# Altium schematic sheet Breakout_schematic.SchDoc
size A3; SheetNumber: 1; SheetTotal: 1
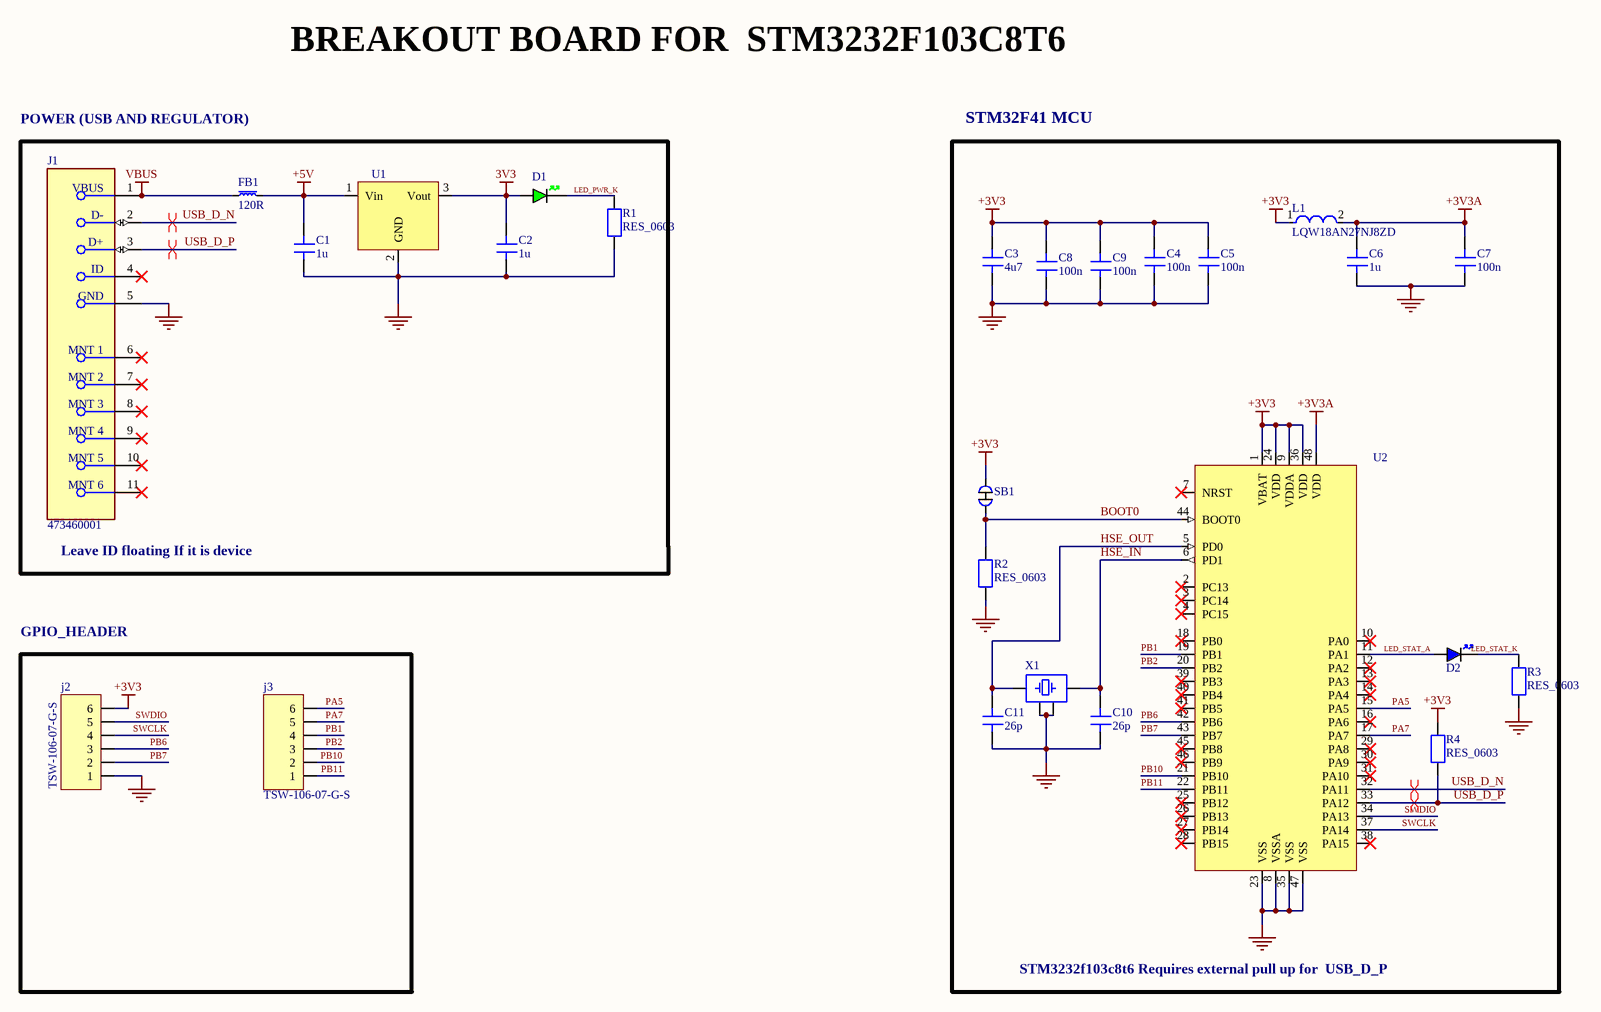
[diagram p0: Breakout_schematic.SchDoc]

## Parts
C1  1u  [CAP_0603]
C2  1u  [CAP_0603]
C3  4u7  [CAP_0603]
C4  100n  [CAP_0603]
C5  100n  [CAP_0603]
C6  1u  [CAP_0603]
C7  100n  [CAP_0603]
C8  100n  [CAP_0603]
C9  100n  [CAP_0603]
C10  26p  [CAP_0603]
C11  26p  [CAP_0603]
D1  Green LED  [DIOC1608X08N]  (value not drawn)
D2  cathodepin2  [DIOC1608X08N]  (value not drawn)
FB1  120R  [Ferrite bead]
J1  473460001  [FP-473460001-MFG]
j2  TSW-106-07-G-S  [Header 1X6]
j3  TSW-106-07-G-S  [Header 1X6]
L1  LQW18AN27NJ8ZD  [FP-LQW18AN_80-MFG]
R1  RES_0603  [RESC1608X08N]
R2  RES_0603  [RESC1608X08N]
R3  RES_0603  [RESC1608X08N]
R4  RES_0603  [RESC1608X08N]
SB1  SolderJumper  [SolderJumper]  (value not drawn)
U1  XC206  [SOT95P280X120-3N]  (value not drawn)
U2  STM3232f103c8t6  [TSQFP50P900X900X160-48N]  (value not drawn)
X1  XTAL_AMB  [XTAL - AMB]  (value not drawn)

## Blocks framed on the sheet
STM32F41 MCU: C3-C11 D2 L1 R2-R4 SB1 U2 X1
GPIO_HEADER: j2 j3

## Nets
3V3: C2.2 D1.1(A) U1.3(Vout)
+3V3: C3.2 C4.2 C5.2 C8.2 C9.2 j2.6 L1.1 R4.1 SB1.2 U2.1(VBAT) U2.9(VDDA) U2.24(VDD) U2.36(VDD)
+3V3A: C6.2 C7.2 L1.2 U2.48(VDD)
+5V: C1.2 FB1.2 U1.1(Vin)
GND: C1.1 C2.1 C3.1 C4.1 C5.1 C6.1 C7.1 C8.1 C9.1 C10.1 C11.1 J1.5(GND) j2.1 R1.1 R2.1 R3.2 U1.2(GND) U2.8(VSSA) U2.23(VSS) U2.35(VSS) U2.47(VSS) X1.2 X1.3
VBUS: FB1.1 J1.1(VBUS)
BOOT0: R2.2 SB1.1 U2.44(BOOT0)
HSE_IN: C10.2 U2.6(PD1) X1.4
HSE_OUT: C11.2 U2.5(PD0) X1.1
LED_PWR_K: D1.2(K) R1.2
LED_STAT_A: D2.1(A) U2.11(PA1)
LED_STAT_K: D2.2(K) R3.1
PA5: j3.6 U2.15(PA5)
PA7: j3.5 U2.17(PA7)
PB1: j3.4 U2.19(PB1)
PB2: j3.3 U2.20(PB2)
PB6: j2.3 U2.42(PB6)
PB7: j2.2 U2.43(PB7)
PB10: j3.2 U2.21(PB10)
PB11: j3.1 U2.22(PB11)
SWCLK: j2.4 U2.37(PA14)
SWDIO: j2.5 U2.34(PA13)
USB_D_N: J1.2(D-) U2.32(PA11)
USB_D_P: J1.3(D+) R4.2 U2.33(PA12)

Not connected (* = marked no-connect by the designer): J1 4(ID)* 6(MNT_1)* 7(MNT_2)* 8(MNT_3)* 9(MNT_4)* 10(MNT_5)* 11(MNT_6)*; U2 2(PC13)* 3(PC14)* 4(PC15)* 7(NRST)* 10(PA0)* 12(PA2)* 13(PA3)* 14(PA4)* 16(PA6)* 18(PB0)* 25(PB12)* 26(PB13)* 27(PB14)* 28(PB15)* 29(PA8)* 30(PA9)* 31(PA10)* 38(PA15)* 39(PB3)* 40(PB4)* 41(PB5)* 45(PB8)* 46(PB9)*

## Layout directives
differential pair: USB_D_N, USB_D_P

## Notes on the sheet
- BREAKOUT BOARD FOR  STM3232F103C8T6
- POWER (USB AND REGULATOR)
- (near J1) Leave ID floating If it is device
- STM3232f103c8t6 Requires external pull up for  USB_D_P

## Library data of the parts
C1-C11 = CAP_0603: Capacitor SMD Generic
D1 = Green LED: GREEN LED  0603; Manufacture: *; Manufacture part number: *
D2 = BLUE LED: Blue led 0603; Manufacturer: Cree LED; Manufacturer part number: XQAROY-00-0000-000000603
FB1 = FB 0603: Generric ferrite bead 0603
J1 = CMP-2000-05246-2: CONN RCPT USB2.0 MICRO B SMD R/A; Manufacturer: Molex; Conn Orientation: Right Angle; Is Female: yes; Shielding: true; Pitch: 0.65mm; Number Of Contacts: 5; Voltage Rating: 30V; Current Rating: 1.8A; Description: USB - micro B USB 2.0 Receptacle Connector 5 Position Surface Mount, Right Angle; Device Class L2: USB Connectors; Digikey Description: CONN RCPT USB2.0 MICRO B SMD R/A; Height: 2.945mm; RoHS: TRUE; ComponentLink2Description: Datasheet; Octopart: https://octopart.com/47346-0001-molex-7164928; Automotive: No; Package: 0; Category: Conn; Device Class L1: Connectors; Usb Standard: USB 2.0; Temperature: -30°C to +85°C; Temperature Range Low: -30°C; Footprint Url: https://www.molex.com/pdm_docs/sd/473460001_sd.pdf; ComponentLink2URL: https://www.molex.com/webdocs/datasheets/pdf/en-us/0473460001_IO_CONNECTORS.pdf; Lead Free: Yes; Manufacturer Part Number: 473460001; Contact Material: Gold,Nickel; Temperature Range High: +85°C; Device Class L3: unset
j2 j3 = TSW-106-07-G-S: CONN HEADER VERT 6POS 2.54MM; Manufacturer: Samtec Inc.; Manufacturer part number: TSW-106-07-G-S
L1 = CMP-06042-008987-1: Wire Wound RF Inductor for Automotive 27nH ±5% 1200mA 0.098Ω 0603 (1608); Test Frequency: 100MHz; Core Material: Non-Magnetic; Current Rating: 1.2A; DC Resistance (DCR): 98mR; Shielding: Unshielded; Self Resonant Frequency: 3.6GHz; Min Operating Temperature: -55°C; Resistor Type: Wirewound; Case/Package: 0603; Inductance: 27nH; Packaging: Cut Tape; Max Operating Temperature: 125°C; Mount: Surface Mount; Ratings: AEC-Q200; Tolerance: 5%
R1-R4 = RES-0603: Reesitor SMD Generic; Manufacturer: FH (Guangdong Fenghua Advanced Tech); Manufacturer part number: RS-03L2R7JT
U1 = XC206: -40℃~+85℃@(Ta) 1 1uA 200mA 3.3V 6V Fixed Over Current Protection Positive SOT-23-3L Voltage Regulators - Linear, Low Drop Out (LDO) Regulators ROHS; Manufacturer part number: XC6206P332MR-G; Manufacturer: Torex Semicon
U2 = STM3232f103c8t6: STM32 STM32f103c8t6 MCU; Manufacturer: STM32; Manufacture part number: STM3232f103c8t6
X1 = XTAL-AMB: CRYSTAL 8.0000MHZ 18PF SMD; Manufacturer: Abracon LLC; Manufacturer part number: 535-9720-2-ND